# Altium project 7000_0303_Rev13.PrjPcb (part 3 of 3)
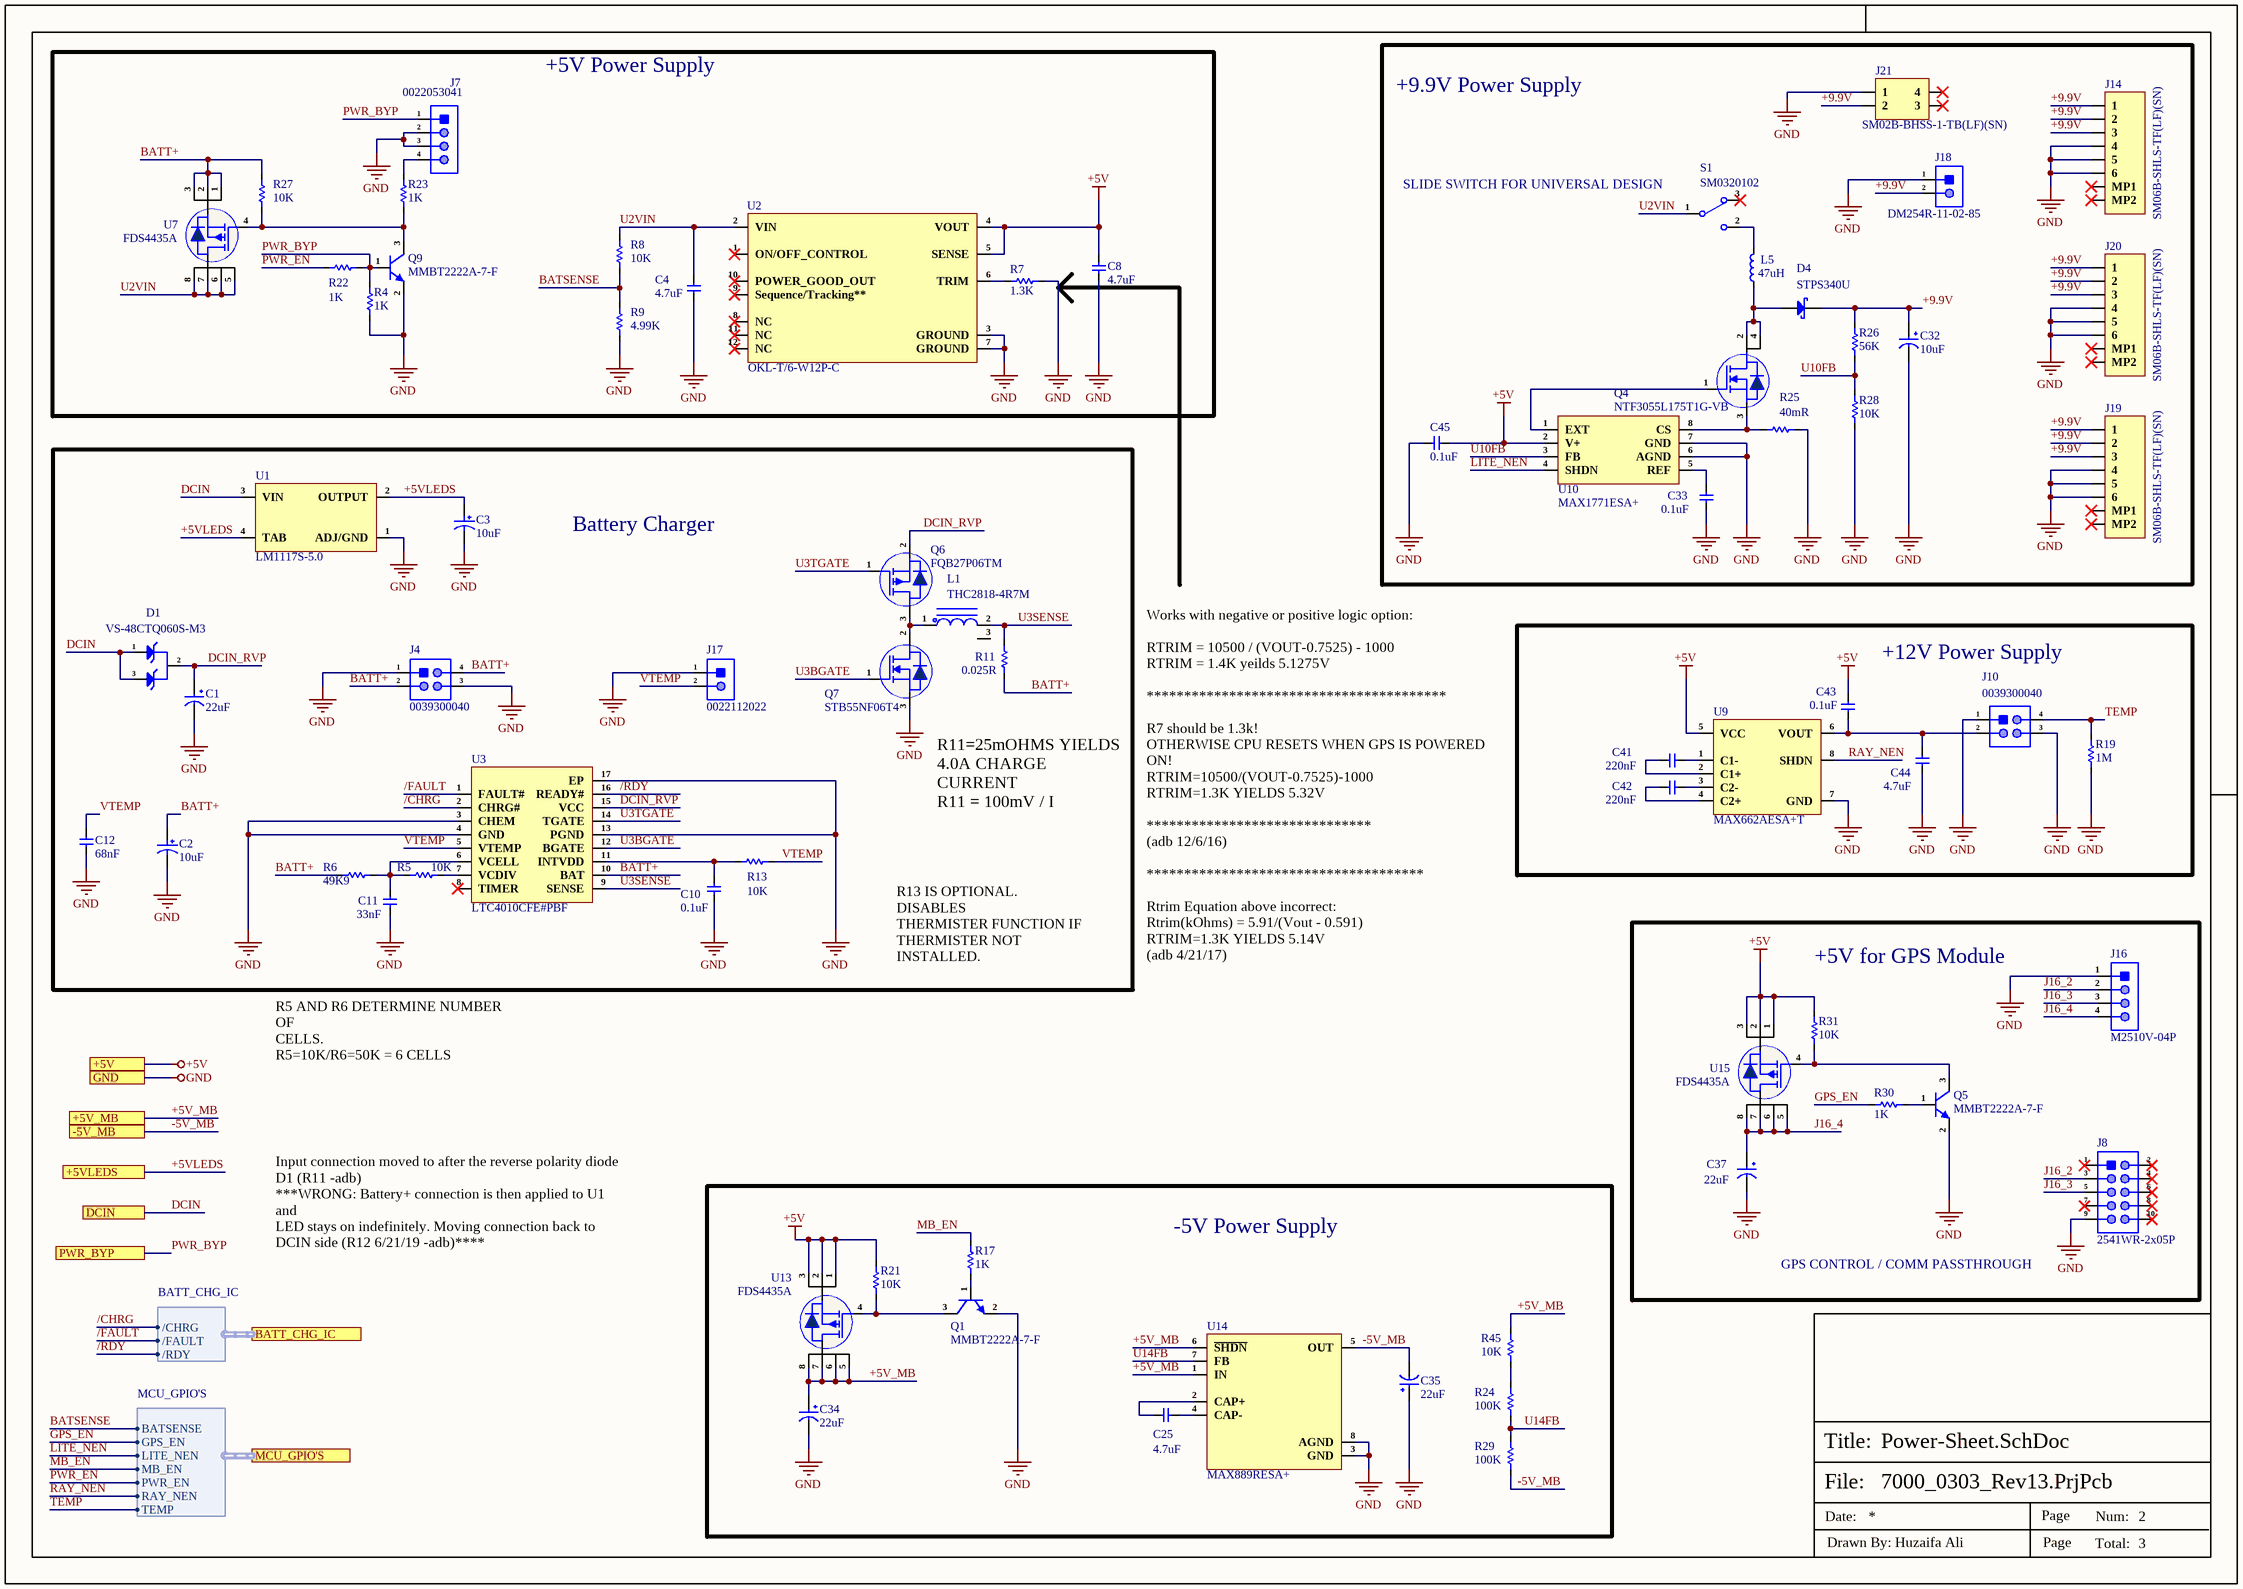
[diagram p4: Power-Sheet.SchDoc]

## Sheet Power-Sheet.SchDoc (continued)

### Library data of the parts (continued)
U10 = MAX1771ESA+: Switching Controllers 12V or Adjustable, High-Efficiency, Low IQ, Step-Up DC-DC Controller; Manufacturer: Maxim; Item Type: IC; Supplier: Mouser; Supplier Part Number: 700-MAX1771ESA; Manufacturer Part Number: MAX1771ESA+; RoHS: Yes; Stock: 3278; Pricing: 1=7.36, 10=6.33, 50=6.23, 100=5.5, 1000=4.19, 10000=4.19 (USD); ComponentLink1URL: https://datasheet.ciiva.com/4877/max1771-100479-4877792.pdf?src-supplier=Mouser; ComponentLink1Description: https://datasheet.ciiva.com/4877/max1771-100479-4877792.pdf?src-supplier=Mouser; ComponentLink2URL: https://datasheet.ciiva.com/14150/max1771-eng-tds-14150776.pdf?src-supplier=Distrelec; ComponentLink2Description: https://datasheet.ciiva.com/14150/max1771-eng-tds-14150776.pdf?src-supplier=Distrelec; ComponentLink3URL: https://datasheet.ciiva.com/3217/max1771-3217307.pdf?src-supplier=Avnet; ComponentLink3Description: https://datasheet.ciiva.com/3217/max1771-3217307.pdf?src-supplier=Avnet; ComponentLink4URL: https://datasheet.ciiva.com/2016/max1771-2016789.pdf?src-supplier=Digikey; ComponentLink4Description: https://datasheet.ciiva.com/2016/max1771-2016789.pdf?src-supplier=Digikey
U14 = MAX889RESA+: IC REG CHRG PUMP ADJ 200MA 8SOIC; Manufacturer: Maxim; Supplier: Mouser; Supplier Part Number: 700-MAX889RESA; Manufacturer Part Number: MAX889RESA+; RoHS: Yes; Item Type: IC; Stock: 621; Pricing: 1=6.21, 10=5.28, 50=5.28, 100=4.56, 1000=3.28, 10000=3.11 (USD); ComponentLink1URL: https://datasheet.ciiva.com/30477/0900766b81253d0c-30477617.pdf?src-supplier=Rs; ComponentLink1Description: https://datasheet.ciiva.com/30477/0900766b81253d0c-30477617.pdf?src-supplier=Rs; ComponentLink2URL: https://datasheet.ciiva.com/3215/max889-3215733.pdf?src-supplier=Avnet; ComponentLink2Description: https://datasheet.ciiva.com/3215/max889-3215733.pdf?src-supplier=Avnet; ComponentLink3URL: https://datasheet.ciiva.com/4874/max889-4874923.pdf?src-supplier=Mouser; ComponentLink3Description: https://datasheet.ciiva.com/4874/max889-4874923.pdf?src-supplier=Mouser; ComponentLink4URL: https://datasheet.ciiva.com/2028/max889-2028980.pdf?src-supplier=Digikey; ComponentLink4Description: https://datasheet.ciiva.com/2028/max889-2028980.pdf?src-supplier=Digikey

## Nets that join several sheets
+5V: Controller-Sheet (37 pins), Power-Sheet (15 pins)
+5VLEDS: Controller-Sheet (R1.2 R2.1 R3.1 U11.14), Power-Sheet (C3.1 U1.2 U1.4)
GND: Controller-Sheet (46 pins), Power-Sheet (57 pins)
+5V_MB: Controller-Sheet (J3.3 J6.3 J6.4), Power-Sheet (8 pins)
-5V_MB: Controller-Sheet (J6.11 J6.12), Power-Sheet (C35.2 R29.1 U14.5)
/CHRG: Controller-Sheet (R1.1 U11.1 U11.4 U11.5), Power-Sheet (U3.2)
/FAULT: Controller-Sheet (R2.2 U11.2 U11.13), Power-Sheet (U3.1)
/RDY: Controller-Sheet (R3.2), Power-Sheet (U3.16)
BATSENSE: Controller-Sheet (U4.24), Power-Sheet (R8.2 R9.2)
DCIN: Controller-Sheet (R16.2 R41.1), Power-Sheet (D1.1 D1.3 U1.3)
GPS_EN: Controller-Sheet (U4.52), Power-Sheet (R30.2)
LITE_NEN: Controller-Sheet (U4.53), Power-Sheet (U10.4)
MB_EN: Controller-Sheet (U4.55), Power-Sheet (R17.2)
PWR_BYP: Controller-Sheet (Q2.3 R16.1), Power-Sheet (J7.1 Q9.1 R4.1 R22.1)
PWR_EN: Controller-Sheet (U4.58), Power-Sheet (R22.2)
RAY_NEN: Controller-Sheet (U4.54), Power-Sheet (U9.8)
TEMP: Controller-Sheet (U4.23), Power-Sheet (J10.4 R19.2)